# Altium project S8050_C20069125.PrjPcb
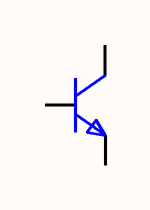
[diagram p0: S8050_C20069125.schdoc]
1 sheet, 1 parts. Net scope: global (net labels, ports and power ports of the same name join across sheets).

## Sheet S8050_C20069125.schdoc
size 127 x 101 mm

### Parts
Q?  s8050_c20069125  [SOT-23-3_L2.9-W1.3-P1.90-LS2.3-BR]  (value not drawn)

### Nets

Not connected (* = marked no-connect by the designer): Q? 1(B) 2(E) 3(C)

### Library data of the parts
Q? = s8050_c20069125: 晶体管类型:NPN;集电极电流(Ic):500mA;集射极击穿电压(Vceo):25V;耗散功率(Pd):300mW;直流电流增益(hFE):120;; Manufacturer: R+O(宏嘉诚); ManufacturerPart: S8050; AddInBom: yes; ModelId: 5504beb8757f4de79731898ec55d3e54; ModelTransform: 114.173,90.551,0,90,0,0,0,0,0; type: NPN; Current - Collector(Ic): 500mA; Collector - Emitter Voltage VCEO: 25V; Pd - Power Dissipation: 300mW; DC Current Gain: 120; Transition frequency(fT): 100MHz; Current - Collector Cutoff: 100nA; Vce Saturation(VCE(sat)): 600mV; Emitter-Base Voltage(Vebo): 5V; Number: 1个NPN; Configuration: 独立式; Symbol: S8050_C20069125; LCSC Part Name: hFE:200-350，丝印:J3Y NPN 500mA 25V; SupplierPart: C20069125; Supplier Footprint: SOT-23; JLCPCB Part Class: Extended Part; Datasheet: https://item.szlcsc.com/datasheet/S8050/21397163.html; Supplier: LCSC; ConvertToPcb: yes; FootprintName: SOT-23-3_L2.9-W1.3-P1.90-LS2.3-BR; ModelName: SOT-23-3_L2.9-W1.3-P1.90-LS2.3-BR; Operating Temperature: -55℃~+150℃